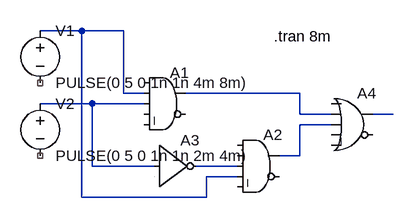
[diagram p0: schematic 11c.asc]
11c.asc, the LTspice schematic file:
Version 4.1
SHEET 1 880 680
WIRE -16 64 -80 64
WIRE 48 64 -16 64
WIRE 48 160 48 64
WIRE 80 160 48 160
WIRE 320 160 144 160
WIRE 0 176 -80 176
WIRE 80 176 0 176
WIRE 320 192 320 160
WIRE 368 192 320 192
WIRE 464 192 432 192
WIRE 368 208 320 208
WIRE 320 256 320 208
WIRE 320 256 288 256
WIRE 0 272 0 176
WIRE 96 272 0 272
WIRE 224 272 160 272
WIRE 224 288 176 288
WIRE -16 320 -16 64
WIRE 176 320 176 288
WIRE 176 320 -16 320
SYMBOL Digital\\and 112 112 R0
SYMATTR InstName A1
SYMBOL Digital\\and 256 208 R0
SYMATTR InstName A2
SYMBOL Digital\\inv 96 208 R0
SYMATTR InstName A3
SYMBOL voltage -80 48 R0
WINDOW 123 0 0 Left 0
WINDOW 39 0 0 Left 0
SYMATTR InstName V1
SYMATTR Value PULSE(0 5 0 1n 1n 4m 8m)
SYMBOL voltage -80 160 R0
WINDOW 123 0 0 Left 0
WINDOW 39 0 0 Left 0
SYMATTR InstName V2
SYMATTR Value PULSE(0 5 0 1n 1n 2m 4m)
SYMBOL Digital\\or 400 144 R0
SYMATTR InstName A4
TEXT 280 72 Left 2 !.tran 8m

The netlist it stands for:
* 11c.asc
A1 0 N001 N003 0 0 0 N002 0 AND
A2 0 0 N006 N001 0 0 N005 0 AND
A3 N003 0 0 0 0 N006 0 0 BUF
V1 N001 NC_01 PULSE(0 5 0 1n 1n 4m 8m)
V2 N003 NC_02 PULSE(0 5 0 1n 1n 2m 4m)
A4 0 N002 N005 0 0 0 N004 0 OR
.tran 8m
.backanno
.end